# Altium project Karta Radiowa.PrjPcb (part 2 of 9)

## Sheet Komunikacja.SchDoc
size A3
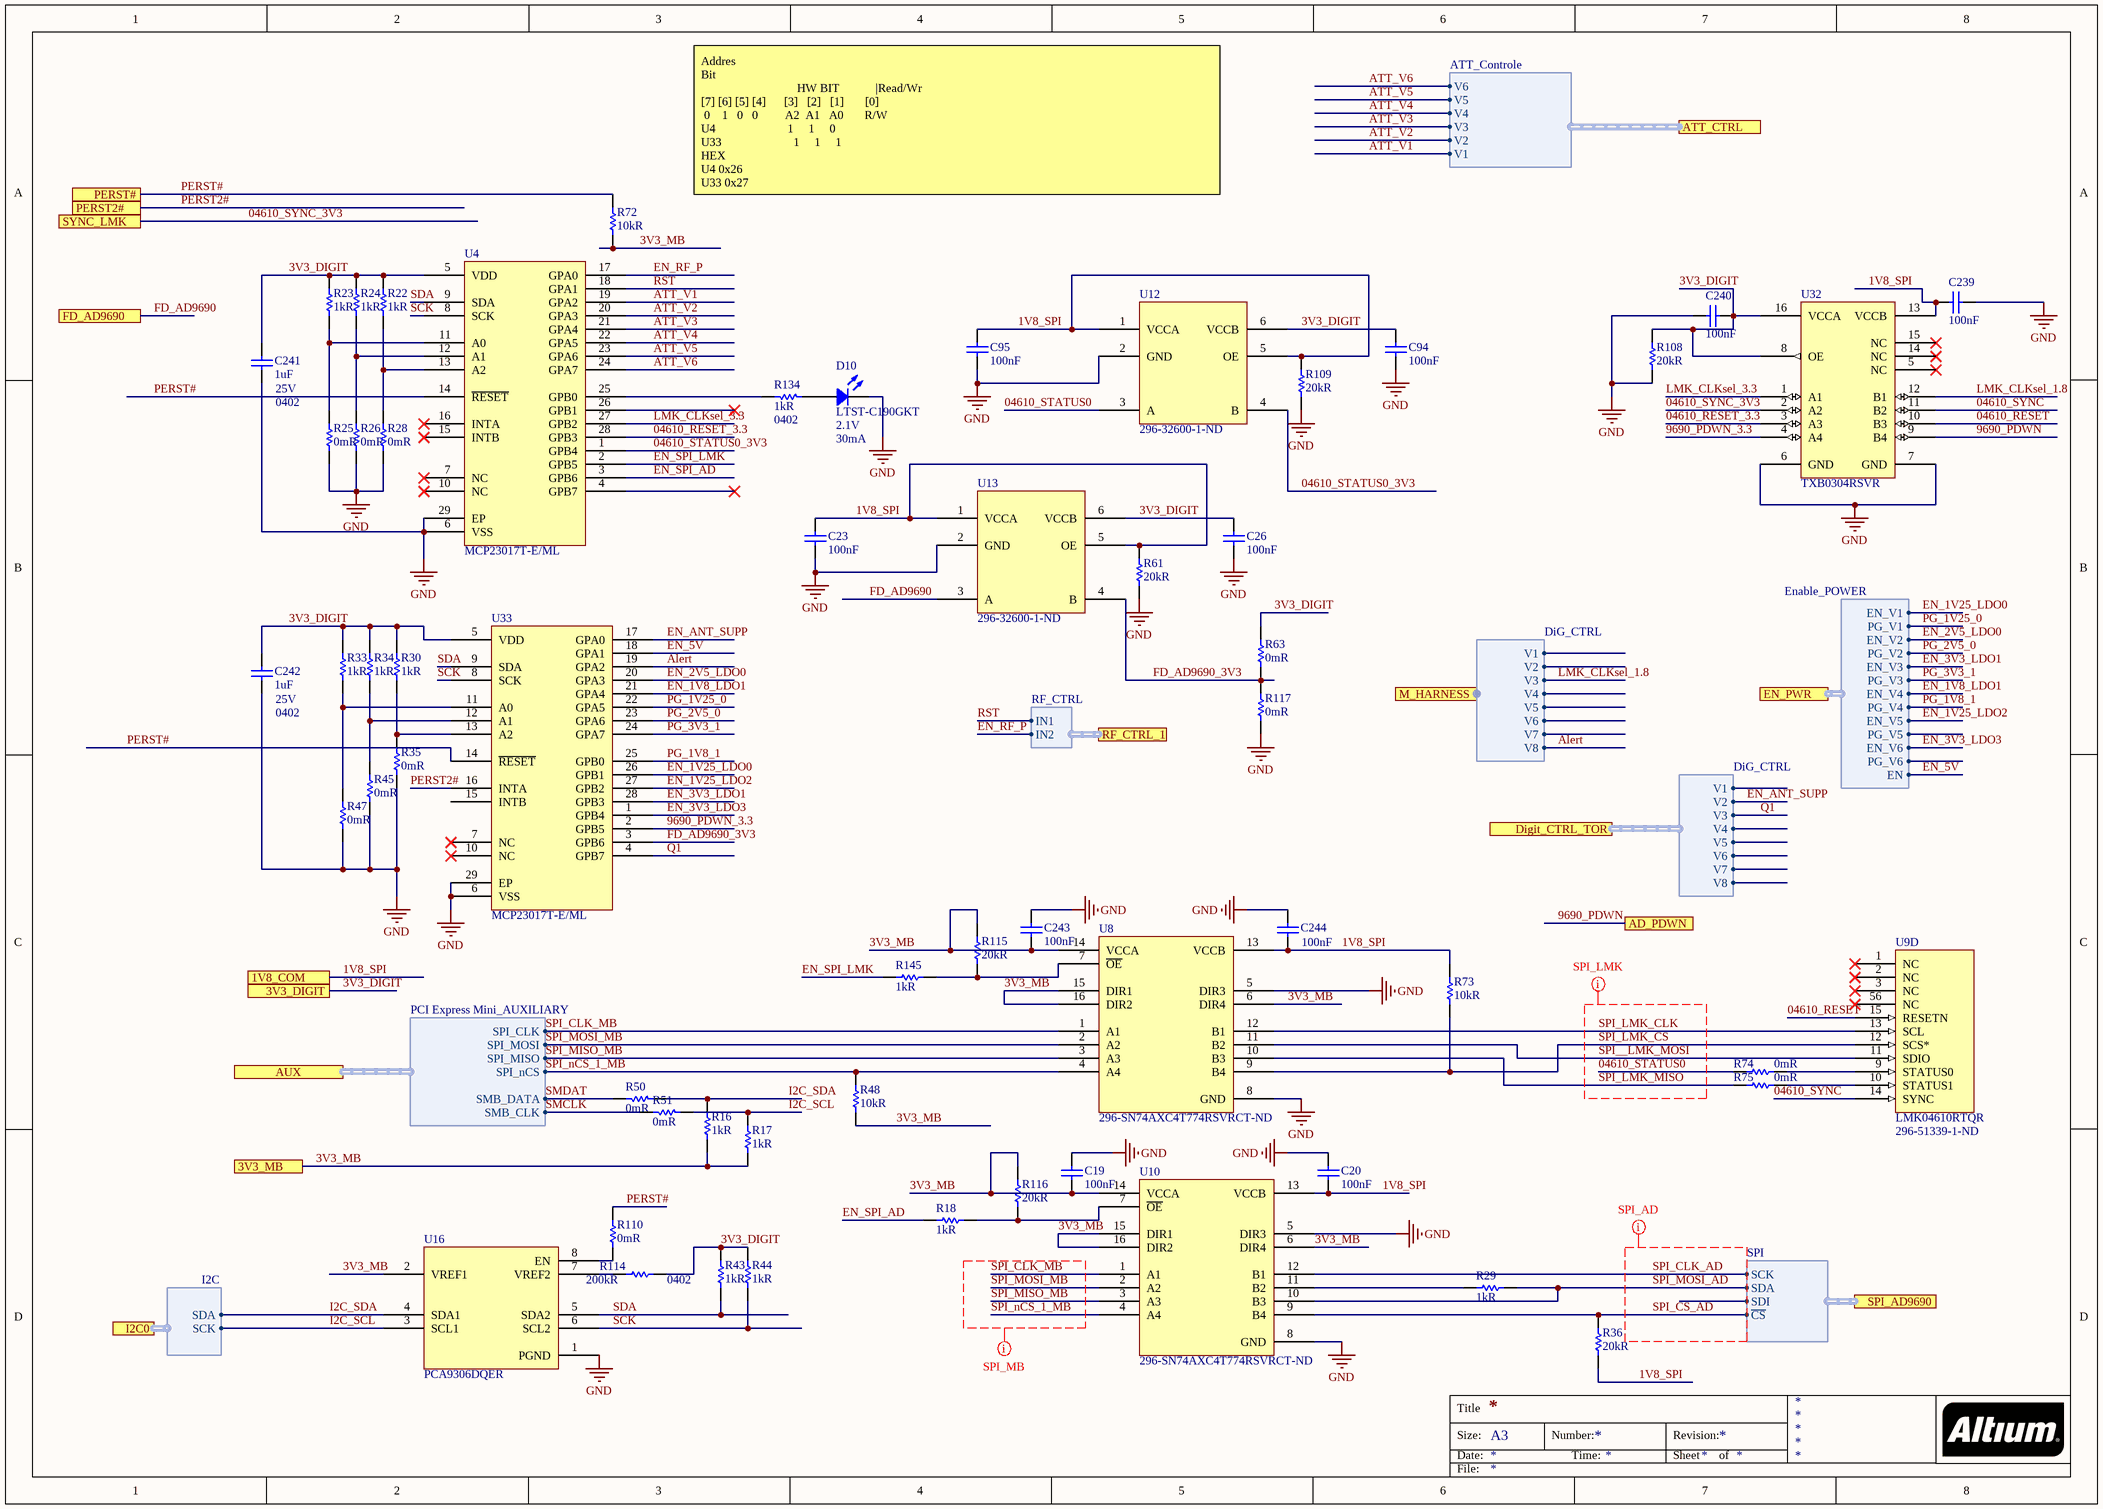
[diagram p2: Komunikacja.SchDoc]

### Parts
C19  100nF  [CAP 0201/0603 KK]
C20  100nF  [CAP 0201/0603 KK]
C23  100nF  [CAP 0201/0603 KK]
C26  100nF  [CAP 0201/0603 KK]
C94  100nF  [CAP 0201/0603 KK]
C95  100nF  [CAP 0201/0603 KK]
C239  100nF  [CAP 0201/0603 KK]
C240  100nF  [CAP 0201/0603 KK]
C241  1uF  Case/Package: 0402  Voltage Rating: 25V  [CAP 0402/1005 RF KK]
C242  1uF  Case/Package: 0402  Voltage Rating: 25V  [CAP 0402/1005 RF KK]
C243  100nF  [CAP 0201/0603 KK]
C244  100nF  [CAP 0201/0603 KK]
D10  LTST-C190GKT  Forward Voltage: 2.1V  Forward Current: 30mA  [LED 0603/1608 GREEN]
R16  1kR  [RES 0402/1005 RF KK]
R17  1kR  [RES 0402/1005 RF KK]
R18  1kR  [RES 0402/1005 RF KK]
R22  1kR  [RES 0402/1005 RF KK]
R23  1kR  [RES 0402/1005 RF KK]
R24  1kR  [RES 0402/1005 RF KK]
R25  0mR  [RES 0402/1005 RF KK]
R26  0mR  [RES 0402/1005 RF KK]
R28  0mR  [RES 0402/1005 RF KK]
R29  1kR  [RES 0402/1005 RF KK]
R30  1kR  [RES 0402/1005 RF KK]
R33  1kR  [RES 0402/1005 RF KK]
R34  1kR  [RES 0402/1005 RF KK]
R35  0mR  [RES 0402/1005 RF KK]
R36  20kR  [RES 0402/1005 RF KK]
R43  1kR  [RES 0402/1005 RF KK]
R44  1kR  [RES 0402/1005 RF KK]
R45  0mR  [RES 0402/1005 RF KK]
R47  0mR  [RES 0402/1005 RF KK]
R48  10kR  [RES 0402/1005 RF KK]
R50  0mR  [RES 0402/1005 RF KK]
R51  0mR  [RES 0402/1005 RF KK]
R61  20kR  [RES 0402/1005 RF KK]
R63  0mR  [RES 0402/1005 RF KK]
R72  10kR  [RES 0402/1005 RF KK]
R73  10kR  [RES 0402/1005 RF KK]
R74  0mR  [RES 0402/1005 RF KK]
R75  0mR  [RES 0402/1005 RF KK]
R108  20kR  [RES 0402/1005 RF KK]
R109  20kR  [RES 0402/1005 RF KK]
R110  0mR  [RES 0402/1005 RF KK]
R114  200kR  Case/Package: 0402  [RES 0402/1005 RF KK]
R115  20kR  [RES 0402/1005 RF KK]
R116  20kR  [RES 0402/1005 RF KK]
R117  0mR  [RES 0402/1005 RF KK]
R134  1kR  Case/Package: 0402  [RES 0402/1005 RF KK]
R145  1kR  [RES 0402/1005 RF KK]
U4  MCP23017T-E/ML  [MCP23017/MCP23S17]
U8  Supplier Part Number 1: 296-SN74AXC4T774RSVRCT-ND  [16-UGFN]  (hidden comment: SN74AXC4T774RSVR)
U9  LMK04610RTQR  Supplier Part Number 1: 296-51339-1-ND  [LMK04610]  (part D of 4)
U10  Supplier Part Number 1: 296-SN74AXC4T774RSVRCT-ND  [16-UGFN]  (hidden comment: SN74AXC4T774RSVR)
U12  Supplier Part Number 1: 296-32600-1-ND  [6-SOT DRL0006A]  (hidden comment: TXB0101DRLT)
U13  Supplier Part Number 1: 296-32600-1-ND  [6-SOT DRL0006A]  (hidden comment: TXB0101DRLT)
U16  PCA9306DQER  [PCA9306]
U32  TXB0304RSVR  [TXB0304]
U33  MCP23017T-E/ML  [MCP23017/MCP23S17]

### Ports
1V8_COM, 3V3_DIGIT, 3V3_MB, AD_PDWN, ATT_CTRL (harness ATT_Controle), AUX (harness PCI Express Mini_AUXILIARY), Digit_CTRL_TOR (harness DiG_CTRL), EN_PWR (harness Enable_POWER), FD_AD9690, I2C0 (harness I2C), M_HARNESS (harness DiG_CTRL), PERST2#, PERST#, RF_CTRL_1 (harness RF_CTRL), SPI_AD9690 (harness SPI), SYNC_LMK

### Harnesses
I2C: SDA, SCK
PCI Express Mini_AUXILIARY: SMB_DATA, SMB_CLK, SPI_nCS, SPI_MISO, SPI_MOSI, SPI_CLK
ATT_Controle: V1, V2, V3, V4, V5, V6
DiG_CTRL: V1, V2, V3, V4, V5, V6, V7, V8
SPI: SCK, ~{CS}, SDA, SDI
Enable_POWER: EN_V1, PG_V1, EN_V2, PG_V2, EN_V3, PG_V3, EN_V4, PG_V4, EN_V5, PG_V5, EN_V6, PG_V6, EN
RF_CTRL: IN1, IN2

### Nets
3V3_MB: C19.1 C243.1 R16.2 R17.1 R48.2 R72.1 R115.2 R116.2 U8.6(DIR4) U8.14(VCCA) U8.15(DIR1) U8.16(DIR2) U10.6(DIR4) U10.14(VCCA) U10.15(DIR1) U10.16(DIR2) U16.2(VREF1) ; port 3V3_MB
GND: C19.2 C20.2 C23.1 C26.1 C94.1 C95.1 C239.2 C240.1 C241.1 C242.1 C243.2 C244.2 D10.2 R25.1 R26.1 R28.1 R35.1 R45.1 R47.1 R61.1 R108.1 R109.1 R117.1 U4.6(VSS) U4.29(EP) U8.5(DIR3) U8.8(GND) U10.5(DIR3) U10.8(GND) U12.2(GND) U13.2(GND) U16.1(PGND) U32.6(GND) U32.7(GND) U33.6(VSS) U33.29(EP)
1V8_SPI: C20.1 C23.2 C95.2 C239.1 C244.1 R36.1 R61.2 R73.2 R109.2 U8.13(VCCB) U10.13(VCCB) U12.1(VCCA) U12.5(OE) U13.1(VCCA) U13.5(OE) U32.13(VCCB) ; port 1V8_COM  [project net 1V8@0A5_COM]
3V3_DIGIT: C26.2 C94.2 C240.2 C241.2 C242.2 R22.2 R23.2 R24.2 R30.2 R33.2 R34.2 R43.2 R44.2 R63.2 R108.2 R114.2 U4.5(VDD) U12.6(VCCB) U13.6(VCCB) U32.8(OE) U32.16(VCCA) U33.5(VDD) ; port 3V3_DIGIT  [project net 3V3@0A5_COM]
04610_RESET: U9.15(RESETN) U32.10(B3)
04610_RESET_3.3: U4.28(GPB3) U32.3(A3)
04610_STATUS0: R74.2 U12.3(A)
04610_STATUS0_3V3: U4.1(GPB4) U12.4(B)
04610_SYNC: U9.14(SYNC) U32.11(B2)
04610_SYNC_3V3: U32.2(A2) ; port SYNC_LMK
9690_PDWN: U32.9(B4) ; port AD_PDWN
9690_PDWN_3.3: U32.4(A4) U33.2(GPB5)
Alert: U33.19(GPA2) ; port M_HARNESS.V8
ATT_V1: U4.19(GPA2) ; port ATT_CTRL.V1
ATT_V2: U4.20(GPA3) ; port ATT_CTRL.V2
ATT_V3: U4.21(GPA4) ; port ATT_CTRL.V3
ATT_V4: U4.22(GPA5) ; port ATT_CTRL.V4
ATT_V5: U4.23(GPA6) ; port ATT_CTRL.V5
ATT_V6: U4.24(GPA7) ; port ATT_CTRL.V6
EN_1V8_LDO1: U33.21(GPA4) ; port EN_PWR.EN_V4
EN_1V25_LDO0: U33.26(GPB1) ; port EN_PWR.EN_V1
EN_1V25_LDO2: U33.27(GPB2) ; port EN_PWR.EN_V5
EN_2V5_LDO0: U33.20(GPA3) ; port EN_PWR.EN_V2
EN_3V3_LDO1: U33.28(GPB3) ; port EN_PWR.EN_V3
EN_3V3_LDO3: U33.1(GPB4) ; port EN_PWR.EN_V6
EN_5V: U33.18(GPA1) ; port EN_PWR.EN
EN_ANT_SUPP: U33.17(GPA0) ; port Digit_CTRL_TOR.V2
EN_RF_P: U4.17(GPA0) ; port RF_CTRL_1.IN2
EN_SPI_AD: R18.2 U4.3(GPB6)
EN_SPI_LMK: R145.2 U4.2(GPB5)
FD_AD9690: U13.3(A) ; port FD_AD9690  [project net 9690_FAST_DETECT]
FD_AD9690_3V3: R63.1 R117.2 U13.4(B) U33.3(GPB6)
I2C_SCL: R17.2 R51.2 U16.3(SCL1) ; port I2C0.SCK
I2C_SDA: R16.1 R50.2 U16.4(SDA1) ; port I2C0.SDA
LMK_CLKsel_1.8: U32.12(B1) ; port M_HARNESS.V3  [project net LMK_CLKsel]
LMK_CLKsel_3.3: U4.27(GPB2) U32.1(A1)
PERST2#: U33.16(INTA) ; port PERST2#
PERST#: R72.2 R110.2 U4.14(~{RESET}) U33.14(~{RESET}) ; port PERST#
PG_1V8_1: U33.25(GPB0) ; port EN_PWR.PG_V4
PG_1V25_0: U33.22(GPA5) ; port EN_PWR.PG_V1
PG_2V5_0: U33.23(GPA6) ; port EN_PWR.PG_V2
PG_3V3_1: U33.24(GPA7) ; port EN_PWR.PG_V3
Q1: U33.4(GPB7) ; port Digit_CTRL_TOR.V3  [project net Q]
RST: U4.18(GPA1) ; port RF_CTRL_1.IN1
SCK: R44.1 U4.8(SCK) U16.6(SCL2) U33.8(SCK)
SDA: R43.1 U4.9(SDA) U16.5(SDA2) U33.9(SDA)
SMCLK: R51.1 ; port AUX.SMB_CLK
SMDAT: R50.1 ; port AUX.SMB_DATA
SPI__LMK_MOSI: U8.11(B2) U9.11(SDIO)
SPI_CLK_AD: U10.12(B1) ; port SPI_AD9690.SCK
SPI_CLK_MB: U8.1(A1) U10.1(A1) ; port AUX.SPI_CLK
SPI_CS_AD: R36.2 U10.9(B4) ; port SPI_AD9690.~{CS}
SPI_LMK_CLK: U8.12(B1) U9.13(SCL)
SPI_LMK_CS: R73.1 U8.9(B4) U9.12(SCS*)
SPI_LMK_MISO: R75.2 U8.10(B3)
SPI_MISO_MB: U8.3(A3) U10.3(A3) ; port AUX.SPI_MISO
SPI_MOSI_AD: R29.1 U10.10(B3) ; port SPI_AD9690.SDA
SPI_MOSI_MB: U8.2(A2) U10.2(A2) ; port AUX.SPI_MOSI
SPI_nCS_1_MB: R48.1 U8.4(A4) U10.4(A4) ; port AUX.SPI_nCS
NetD10_1: D10.1 R134.1
NetR18_1: R18.1 R116.1 U10.7(~{OE})
NetR22_1: R22.1 R28.2 U4.13(A2)
NetR23_1: R23.1 R25.2 U4.11(A0)
NetR24_1: R24.1 R26.2 U4.12(A1)
NetR29_2: R29.2 U10.11(B2)
NetR30_1: R30.1 R35.2 U33.13(A2)
NetR33_1: R33.1 R47.2 U33.11(A0)
NetR34_1: R34.1 R45.2 U33.12(A1)
NetR74_1: R74.1 U9.9(STATUS0)
NetR75_1: R75.1 U9.10(STATUS1)
NetR110_1: R110.1 U16.8(EN)
NetR114_1: R114.1 U16.7(VREF2)
NetR115_1: R115.1 R145.1 U8.7(~{OE})
NetR134_2: R134.2 U4.25(GPB0)

Not connected (* = marked no-connect by the designer): U4 4(GPB7)* 7(NC)* 10(NC)* 15(INTB)* 16(INTA)* 26(GPB1)*; U9 1(NC)* 2(NC)* 3(NC)* 56(NC)*; U32 5(NC)* 14(NC)* 15(NC)*; U33 7(NC)* 10(NC)* 15(INTB)

### Layout directives
net class SPI_LMK: 04610_STATUS0, SPI__LMK_MOSI, SPI_LMK_CLK, SPI_LMK_CS, SPI_LMK_MISO
net class SPI_AD: SPI_CLK_AD, SPI_CS_AD, SPI_MOSI_AD
net class SPI_MB: SPI_CLK_MB, SPI_MISO_MB, SPI_MOSI_MB, SPI_nCS_1_MB

### Notes on the sheet
- Addres
  Bit
  HW BIT            |Read/Wr
  [7] [6] [5] [4]      [3]   [2]   [1]       [0]
  0    1   0   0         A2  A1   A0       R/W
  U4                        1     1     0
  U33                        1     1     1
  HEX
  U4 0x26
  U33 0x27
- Title
- Size:
- Date:
- A3
- Number:
- Time:
- Revision:
- Sheet
- of
- File:

### Library data of the parts
C19 C20 C23 C26 C94 C95 C239 C240 C243 C244 = Capacitor: Manufacturer 1: Murata; Manufacturer Part Number 1: GRM033R61C104ME84D; Voltage Rating: 16V; Tolerance: 20%; Dielectric: X5R; Supplier 1: Digi-Key; Supplier Part Number 1: 490-9986-1-ND; Stock 1: 550070; Pricing 1: 1=0.10000, 10=0.05400, 100=0.02430, 500=0.01732, 1000=0.01361, 2500=0.01238, 5000=0.01139 (USD); RoHS: Yes; Mount: Surface Mount; Case/Package: 0201; Weight: 1.2E-05oz; Case Code (Metric): 0603; Case Code (Imperial): 0201; Min Operating Temperature: -55°C; Max Operating Temperature: 85°C; Capacitance: 100nF; Packaging: Tape and Reel; Termination: SMD/SMT; Voltage Rating (DC): 16V; Package Quantity: 15000; Length: 0.024inch; Height: 0.3mm; Width: 0.3mm; Thickness: 0.013inch; ComponentLink1URL: http://www.mouser.com/ds/2/281/c02e-2905.pdf?src-supplier=Mouser; ComponentLink1Description: http://www.mouser.com/ds/2/281/c02e-2905.pdf?src-supplier=Mouser; ComponentLink2URL: http://search.murata.co.jp/Ceramy/image/img/A01X/G101/ENG/GRM033R61C104ME84-01.pdf?src-supplier=Digi-Key; ComponentLink2Description: http://search.murata.co.jp/Ceramy/image/img/A01X/G101/ENG/GRM033R61C104ME84-01.pdf?src-supplier=Digi-Key
C241 C242 = Capacitor: MURATA - GRT155R61E105KE01D - SMD Multilayer Ceramic Capacitor, 1 µF, 25 V, 0402 [1005 Metric], ± 10%, X5R, GRT Series - SMD Multilayer Ceramic Capacitor, 1 µF, 25 V, 0402 [1005 Metric], ± 10%, X5R, GRT Series; Supplier 1: Digi-Key; Supplier Part Number 1: 490-12263-1-ND; Manufacturer: Murata; Manufacturer Part Number: GRT155R61E105KE01D; RoHS: Yes; Category: Ceramic Capacitors; Stock 1: 341453; Pricing 1: 1=0,18000, 10=0,12300, 100=0,06210, 500=0,04248, 1000=0,03758, 2500=0,03594, 5000=0,03268 (USD); Mount: Surface Mount; Case Code (Metric): 1005; Case Code (Imperial): 0402; Min Operating Temperature: -55°C; Max Operating Temperature: 85°C; Packaging: Tape and Reel; Capacitance: 1uF; Tolerance: 10%; Dielectric: X5R; Voltage Rating (DC): 25V; Length: 0.039inch; Width: 0.02inch; Thickness: 0.022inch; Ratings: AEC-Q200; ComponentLink1URL: http://www.farnell.com/datasheets/2165918.pdf?src-supplier=Farnell; ComponentLink1Description: http://www.farnell.com/datasheets/2165918.pdf?src-supplier=Farnell; ComponentLink2URL: http://search.murata.co.jp/Ceramy/image/img/A01X/G101/ENG/GRT155R61E105KE01-01.pdf?src-supplier=Digi-Key; ComponentLink2Description: http://search.murata.co.jp/Ceramy/image/img/A01X/G101/ENG/GRT155R61E105KE01-01.pdf?src-supplier=Digi-Key; ComponentLink3URL: http://www.farnell.com/datasheets/2165918.pdf?src-supplier=Element14; ComponentLink3Description: http://www.farnell.com/datasheets/2165918.pdf?src-supplier=Element14
D10 = LTST-C190GKT: LED,  LTST-C190GKT; Manufacturer 1: Vishay Lite-On; Color: Green; Lens Color: Colorless; Luminous Intensity: 6mcd; Viewing Angle: 130°; Lens Style: Clear,Diffused,Colorless,Rectangular; Power Rating: 100mW; Dominant Wavelength: 569nm; Test Current: 10mA; Lens Transparency: Clear; Number of Elements: 1; Wavelength: 565nm; Voltage: 2V; Reverse Voltage: 5V; Supplier 1: Digi-Key; Manufacturer Part Number 1: LTST-C190GKT; Stock 1: 908158; Pricing 1: 1=0.26000, 10=0.18800, 100=0.08880, 500=0.05922, 1000=0.04639 (USD); RoHS: Yes; Mount: Surface Mount; Case/Package: 0603; Number of Pins: 2; Case Code (Metric): 1608; Case Code (Imperial): 0603; Min Operating Temperature: -55°C; Max Operating Temperature: 85°C; Package Quantity: 1; Packaging: Tape and Reel; Illumination Color: Green; Power Dissipation: 100mW; Number of LEDs: 1; Length: 1.6mm; Height: 0.8mm; Width: 0.8mm; Depth: 0.8mm; Radiation Hardening: No; Lead Free: Lead Free; ComponentLink1URL: https://datasheet.ciiva.com/11775/0900766b80dc02a6-11775616.pdf?src-supplier=RSComponents; ComponentLink1Description: https://datasheet.ciiva.com/11775/0900766b80dc02a6-11775616.pdf?src-supplier=RSComponents; ComponentLink2URL: https://datasheet.ciiva.com/2109/ltst-c190gkt-2109985.pdf?src-supplier=Digi-Key; ComponentLink2Description: https://datasheet.ciiva.com/2109/ltst-c190gkt-2109985.pdf?src-supplier=Digi-Key; ComponentLink3URL: https://datasheet.ciiva.com/16392/lite-on20ltst-c190gkt-16392818.pdf?src-supplier=Future+Electronics; ComponentLink3Description: https://datasheet.ciiva.com/16392/lite-on20ltst-c190gkt-16392818.pdf?src-supplier=Future+Electronics; ComponentLink4URL: https://datasheet.ciiva.com/12403/lite-on-ltst-c190gkt-187204-12403884.pdf?src-supplier=Mouser; ComponentLink4Description: https://datasheet.ciiva.com/12403/lite-on-ltst-c190gkt-187204-12403884.pdf?src-supplier=Mouser; ComponentLink5URL: https://datasheet.ciiva.com/2109/ltst-c190gkt-2109986.pdf?src-supplier=Digi-Key; ComponentLink5Description: https://datasheet.ciiva.com/2109/ltst-c190gkt-2109986.pdf?src-supplier=Digi-Key; ComponentLink6URL: https://datasheet.ciiva.com/2109/ltst-c190gkt-2109987.pdf?src-supplier=Digi-Key; ComponentLink6Description: https://datasheet.ciiva.com/2109/ltst-c190gkt-2109987.pdf?src-supplier=Digi-Key; Supplier Part Number 1: 160-1183-1-ND
R16-R18 R22-R24 R29 R30 R33 R34 R43 R44 R134 R145 = Resistor: Manufacturer 1: Yageo; Manufacturer Part Number 1: RC0402FR-071KL; Tolerance: 1%; Temperature Coefficient: 100ppm/°C; Power Rating: 62.5mW; Voltage Rating: 50V; Supplier 1: Digi-Key; Supplier Part Number 1: 311-1.00KLRCT-ND; Stock 1: 57541929; Pricing 1: 1=0,10000, 10=0,01600, 100=0,00640, 1000=0,00289, 2500=0,00251, 5000=0,00207 (USD); RoHS: Yes; Number of Pins: 2; Case Code (Imperial): 0402; Case Code (Metric): 1005; Min Operating Temperature: -55°C; Max Operating Temperature: 155°C; Packaging: Tape and Reel; Resistance: 1kR; Composition: Thick Film; Voltage Rating (DC): 50V; Termination: SMD/SMT; Military Standard: Not; Length: 1mm; Height: 0.32mm; Width: 0.5mm; Depth: 0.5mm; REACH SVHC: Unknown; Lead Free: Lead Free; ComponentLink1URL: https://datasheet.ciiva.com/11819/0900766b80c66297-11819477.pdf?src-supplier=RSComponents; ComponentLink1Description: https://datasheet.ciiva.com/11819/0900766b80c66297-11819477.pdf?src-supplier=RSComponents; ComponentLink2URL: https://datasheet.ciiva.com/12666/pyu-rc0402-51-rohs-l-6-r-12666741.pdf?src-supplier=Mouser; ComponentLink2Description: https://datasheet.ciiva.com/12666/pyu-rc0402-51-rohs-l-6-r-12666741.pdf?src-supplier=Mouser; ComponentLink3URL: https://datasheet.ciiva.com/17063/pyu-rc0402-51-rohs-l-6-r-17063193.pdf?src-supplier=Future+Electronics; ComponentLink3Description: https://datasheet.ciiva.com/17063/pyu-rc0402-51-rohs-l-6-r-17063193.pdf?src-supplier=Future+Electronics; ComponentLink4URL: https://datasheet.ciiva.com/22747/1018594-22747513.pdf?src-supplier=Element14; ComponentLink4Description: https://datasheet.ciiva.com/22747/1018594-22747513.pdf?src-supplier=Element14; ComponentLink5URL: https://datasheet.ciiva.com/7849/1018594-7849869.pdf?src-supplier=Element14; ComponentLink5Description: https://datasheet.ciiva.com/7849/1018594-7849869.pdf?src-supplier=Element14; ComponentLink6URL: https://datasheet.ciiva.com/7983/1018594-7983502.pdf?src-supplier=Element14; ComponentLink6Description: https://datasheet.ciiva.com/7983/1018594-7983502.pdf?src-supplier=Element14; ComponentLink7URL: https://datasheet.ciiva.com/7849/1018594-7849871.pdf?src-supplier=Element14; ComponentLink7Description: https://datasheet.ciiva.com/7849/1018594-7849871.pdf?src-supplier=Element14
  R16-R18 R22-R24 R29 R30 R33 R34 R43 R44 R145: Case/Package: 0402
R25 R26 R28 R35 R45 R47 R50 R51 R63 R74 R75 R110 R117 = Resistor: Manufacturer 1: Yageo; Manufacturer Part Number 1: RC0402JR-070RL; Power Rating: 62.5mW; Tolerance: 5%; Voltage Rating: 50V; Max Power Dissipation: 63mW; Temperature Coefficient: 200ppm/°C; Supplier 1: Digi-Key; Supplier Part Number 1: 311-0.0JRCT-ND; Pricing 1: 1=0.10000, 10=0.01200, 25=0.00920, 50=0.00680, 100=0.00510, 250=0.00388, 500=0.00308, 1000=0.00227, 5000=0.00163 (USD); RoHS: Yes; Case/Package: 0402; Contact Plating: Tin,Matte; Case Code (Metric): 1005; Case Code (Imperial): 0402; Min Operating Temperature: -55°C; Max Operating Temperature: 155°C; Resistance: 0mR; Packaging: Tape and Reel; Composition: Thick Film; Package Quantity: 1; Number of Terminations: 2; Termination: SMD/SMT; Military Standard: Not; Features: Moisture Resistant; Length: 1mm; Height: 0.016inch; Width: 0.02inch; Depth: 0.5mm; Radiation Hardening: No; REACH SVHC: Unknown; Lead Free: Lead Free; ComponentLink1URL: https://datasheet.ciiva.com/2452/pyu-rc0402-51-rohs-l-6-2452608.pdf?src-supplier=Digi-Key; ComponentLink1Description: https://datasheet.ciiva.com/2452/pyu-rc0402-51-rohs-l-6-2452608.pdf?src-supplier=Digi-Key; ComponentLink2URL: https://datasheet.ciiva.com/11808/0900766b80c66297-11808195.pdf?src-supplier=RSComponents; ComponentLink2Description: https://datasheet.ciiva.com/11808/0900766b80c66297-11808195.pdf?src-supplier=RSComponents; ComponentLink3URL: https://datasheet.ciiva.com/2452/pyu-r-int-thick-7-2452609.pdf?src-supplier=Digi-Key; ComponentLink3Description: https://datasheet.ciiva.com/2452/pyu-r-int-thick-7-2452609.pdf?src-supplier=Digi-Key; ComponentLink4URL: https://datasheet.ciiva.com/22747/1018594-22747515.pdf?src-supplier=Element14; ComponentLink4Description: https://datasheet.ciiva.com/22747/1018594-22747515.pdf?src-supplier=Element14; ComponentLink5URL: https://datasheet.ciiva.com/7983/1018594-7983535.pdf?src-supplier=Element14; ComponentLink5Description: https://datasheet.ciiva.com/7983/1018594-7983535.pdf?src-supplier=Element14; ComponentLink6URL: https://datasheet.ciiva.com/2452/pyu-r-int-thick-7-2452610.pdf?src-supplier=Digi-Key; ComponentLink6Description: https://datasheet.ciiva.com/2452/pyu-r-int-thick-7-2452610.pdf?src-supplier=Digi-Key; ComponentLink7URL: https://datasheet.ciiva.com/8896/pyu-rc0402-51-rohs-l-6-8896201.pdf?src-supplier=Avnet; ComponentLink7Description: https://datasheet.ciiva.com/8896/pyu-rc0402-51-rohs-l-6-8896201.pdf?src-supplier=Avnet; ComponentLink8URL: https://datasheet.ciiva.com/28386/pyu-rc0402-51-rohs-l-6-28386633.pdf?src-supplier=Avnet+Europe; ComponentLink8Description: https://datasheet.ciiva.com/28386/pyu-rc0402-51-rohs-l-6-28386633.pdf?src-supplier=Avnet+Europe; ComponentLink9URL: https://datasheet.ciiva.com/15189/getdatasheetpartid-326379-15189533.pdf?src-supplier=Verical; ComponentLink9Description: https://datasheet.ciiva.com/15189/getdatasheetpartid-326379-15189533.pdf?src-supplier=Verical
  R25 R26 R28 R35 R45 R47 R63 R74 R75 R110 R117: Stock 1: 69822252
  R50 R51: Stock 1: 71594280
R36 R61 R108 R109 R115 R116 = Resistor: YAGEO - RC0402FR-0720KL - RES, THICK FILM, 20K, 1%, 0.0625W, 0402; Power Rating: 62.5mW; Voltage Rating: 50V; Temperature Coefficient: 100ppm/°C; Max Power Dissipation: 63mW; Supplier 1: Digi-Key; Supplier Part Number 1: 311-20.0KLRCT-ND; Manufacturer: Yageo; Manufacturer Part Number: RC0402FR-0720KL; RoHS: Yes; Category: Chip SMD Resistors; Stock 1: 5041118; Pricing 1: 1=0,10000, 10=0,01500, 100=0,00620, 1000=0,00278, 2500=0,00242, 5000=0,00200 (USD); Case/Package: 0402; Number of Pins: 2; Case Code (Metric): 1005; Case Code (Imperial): 0402; Min Operating Temperature: -55°C; Max Operating Temperature: 155°C; Tolerance: 1%; Package Quantity: 1; Resistance: 20kR; Packaging: Tape and Reel; Resistor Type: Thick Film; Number of Terminations: 2; Termination: SMD/SMT; Voltage Rating (DC): 50V; Features: Moisture Resistant; Length: 1mm; Height: 0.016inch; Width: 0.02inch; Depth: 0.5mm; REACH SVHC: No SVHC; Military Standard: Not; Lead Free: Lead Free; ComponentLink1URL: https://datasheet.ciiva.com/11808/0900766b80c66297-11808454.pdf?src-supplier=RSComponents; ComponentLink1Description: https://datasheet.ciiva.com/11808/0900766b80c66297-11808454.pdf?src-supplier=RSComponents; ComponentLink2URL: https://datasheet.ciiva.com/2453/pyu-r-int-thick-7-2453493.pdf?src-supplier=Digi-Key; ComponentLink2Description: https://datasheet.ciiva.com/2453/pyu-r-int-thick-7-2453493.pdf?src-supplier=Digi-Key; ComponentLink3URL: https://datasheet.ciiva.com/2453/pyu-r-int-thick-7-2453494.pdf?src-supplier=Digi-Key; ComponentLink3Description: https://datasheet.ciiva.com/2453/pyu-r-int-thick-7-2453494.pdf?src-supplier=Digi-Key; ComponentLink4URL: https://datasheet.ciiva.com/2453/pyu-r-int-thick-7-2453495.pdf?src-supplier=Digi-Key; ComponentLink4Description: https://datasheet.ciiva.com/2453/pyu-r-int-thick-7-2453495.pdf?src-supplier=Digi-Key; ComponentLink5URL: https://datasheet.ciiva.com/7983/1018594-7983511.pdf?src-supplier=Element14; ComponentLink5Description: https://datasheet.ciiva.com/7983/1018594-7983511.pdf?src-supplier=Element14; ComponentLink6URL: https://datasheet.ciiva.com/12558/pyu-rc0402-51-rohs-l-6-r-8721-12558796.pdf?src-supplier=Mouser; ComponentLink6Description: https://datasheet.ciiva.com/12558/pyu-rc0402-51-rohs-l-6-r-8721-12558796.pdf?src-supplier=Mouser; ComponentLink7URL: https://datasheet.ciiva.com/46394/1018594-46394974.pdf?src-supplier=Element14; ComponentLink7Description: https://datasheet.ciiva.com/46394/1018594-46394974.pdf?src-supplier=Element14
R48 R72 R73 = Resistor: Manufacturer 1: Vishay; Manufacturer Part Number 1: CRCW0402-10K0FKED; Tolerance: 1%; Power Rating: 63mW; Voltage Rating: 50V; Temperature Coefficient: 100ppm/°C; Supplier 1: Newark; Supplier Part Number 1: 52K6595; Stock 1: 0; RoHS: Yes; Mount: Surface Mount; Case/Package: 0402; Number of Pins: 2; Weight: 2.3E-05oz; Case Code (Metric): 1005; Case Code (Imperial): 0402; Contact Plating: Tin; Min Operating Temperature: -55°C; Max Operating Temperature: 155°C; Resistance: 10kR; Package Quantity: 10; Packaging: Tape and Reel; Termination: SMD/SMT; Military Standard: Not; Composition: Thick Film; Voltage Rating (DC): 50V; Number of Terminations: 2; Max Power Dissipation: 63mW; Features: Automotive AEC-Q200; Length: 1mm; Height: 0.35mm; Depth: 0.5mm; Width: 0.02inch; Radiation Hardening: No; REACH SVHC: Unknown; Lead Free: Lead Free; ComponentLink1URL: https://datasheet.ciiva.com/11809/0900766b80d98824-11809984.pdf?src-supplier=RSComponents; ComponentLink1Description: https://datasheet.ciiva.com/11809/0900766b80d98824-11809984.pdf?src-supplier=RSComponents; ComponentLink2URL: https://datasheet.ciiva.com/2463/dcrcwe3-2463025.pdf?src-supplier=Digi-Key; ComponentLink2Description: https://datasheet.ciiva.com/2463/dcrcwe3-2463025.pdf?src-supplier=Digi-Key; ComponentLink3URL: https://datasheet.ciiva.com/2463/dcrcwe3-2463026.pdf?src-supplier=Digi-Key; ComponentLink3Description: https://datasheet.ciiva.com/2463/dcrcwe3-2463026.pdf?src-supplier=Digi-Key; ComponentLink4URL: https://datasheet.ciiva.com/2463/dcrcwe3-2463027.pdf?src-supplier=Digi-Key; ComponentLink4Description: https://datasheet.ciiva.com/2463/dcrcwe3-2463027.pdf?src-supplier=Digi-Key; ComponentLink5URL: https://datasheet.ciiva.com/46385/1697337-46385560.pdf?src-supplier=Element14; ComponentLink5Description: https://datasheet.ciiva.com/46385/1697337-46385560.pdf?src-supplier=Element14; ComponentLink6URL: https://datasheet.ciiva.com/3255/dcrcwe3-3255961.pdf?src-supplier=Avnet; ComponentLink6Description: https://datasheet.ciiva.com/3255/dcrcwe3-3255961.pdf?src-supplier=Avnet; ComponentLink7URL: https://datasheet.ciiva.com/3255/dcrcwe3-3255962.pdf?src-supplier=Avnet; ComponentLink7Description: https://datasheet.ciiva.com/3255/dcrcwe3-3255962.pdf?src-supplier=Avnet; ComponentLink8URL: https://datasheet.ciiva.com/5547/dcrcwe3-109170-5547786.pdf?src-supplier=Mouser; ComponentLink8Description: https://datasheet.ciiva.com/5547/dcrcwe3-109170-5547786.pdf?src-supplier=Mouser; ComponentLink9URL: https://datasheet.ciiva.com/26316/fld-crcw-e3-data-en-26316618.pdf?src-supplier=Distrelec; ComponentLink9Description: https://datasheet.ciiva.com/26316/fld-crcw-e3-data-en-26316618.pdf?src-supplier=Distrelec; ComponentLink10URL: https://datasheet.ciiva.com/16208/dcrcwe3-16208525.pdf?src-supplier=Future+Electronics; ComponentLink10Description: https://datasheet.ciiva.com/16208/dcrcwe3-16208525.pdf?src-supplier=Future+Electronics; ComponentLink11URL: https://datasheet.ciiva.com/36856/1720486-36856909.pdf?src-supplier=Element14; ComponentLink11Description: https://datasheet.ciiva.com/36856/1720486-36856909.pdf?src-supplier=Element14
R114 = Resistor: YAGEO - RC0402FR-07200KL - SMD Chip Resistor, 0402 [1005 Metric], 200 kohm, RC Series, 50 V, Thick Film, 63 mW; Power Rating: 62.5mW; Tolerance: 1%; Voltage Rating: 50V; Max Power Dissipation: 63mW; Temperature Coefficient: 100ppm/°C; Supplier 1: Digi-Key; Supplier Part Number 1: 311-200KLRCT-ND; Manufacturer: Yageo; Manufacturer Part Number: RC0402FR-07200KL; RoHS: Yes; Category: Chip SMD Resistors; Stock 1: 2329986; Pricing 1: 1=0,10000, 10=0,01400, 100=0,00580, 1000=0,00260, 2500=0,00226, 5000=0,00186 (USD); Case Code (Metric): 1005; Case Code (Imperial): 0402; Min Operating Temperature: -55°C; Max Operating Temperature: 155°C; Resistance: 200kR; Package Quantity: 1; Packaging: Tape and Reel; Resistor Type: Thick Film; Number of Terminations: 2; Termination: SMD/SMT; Voltage Rating (DC): 50V; Features: Moisture Resistant; Working Voltage: 50V; Length: 1mm; Width: 0.02inch; Height: 0.016inch; Depth: 0.5mm; REACH SVHC: No SVHC; Military Standard: Not; Lead Free: Lead Free; ComponentLink1URL: https://datasheet.ciiva.com/2453/pyu-r-int-thick-7-2453556.pdf?src-supplier=Digi-Key; ComponentLink1Description: https://datasheet.ciiva.com/2453/pyu-r-int-thick-7-2453556.pdf?src-supplier=Digi-Key; ComponentLink2URL: https://datasheet.ciiva.com/2453/pyu-r-int-thick-7-2453557.pdf?src-supplier=Digi-Key; ComponentLink2Description: https://datasheet.ciiva.com/2453/pyu-r-int-thick-7-2453557.pdf?src-supplier=Digi-Key; ComponentLink3URL: https://datasheet.ciiva.com/15189/getdatasheetpartid-323720-15189381.pdf?src-supplier=Verical; ComponentLink3Description: https://datasheet.ciiva.com/15189/getdatasheetpartid-323720-15189381.pdf?src-supplier=Verical; ComponentLink4URL: https://datasheet.ciiva.com/2453/pyu-r-int-thick-7-2453558.pdf?src-supplier=Digi-Key; ComponentLink4Description: https://datasheet.ciiva.com/2453/pyu-r-int-thick-7-2453558.pdf?src-supplier=Digi-Key; ComponentLink5URL: https://datasheet.ciiva.com/12667/pyu-rc0402-51-rohs-l-6-r-12667911.pdf?src-supplier=Mouser; ComponentLink5Description: https://datasheet.ciiva.com/12667/pyu-rc0402-51-rohs-l-6-r-12667911.pdf?src-supplier=Mouser; ComponentLink6URL: https://datasheet.ciiva.com/7849/1018594-7849896.pdf?src-supplier=Element14; ComponentLink6Description: https://datasheet.ciiva.com/7849/1018594-7849896.pdf?src-supplier=Element14; ComponentLink7URL: https://datasheet.ciiva.com/7849/1018594-7849897.pdf?src-supplier=Element14; ComponentLink7Description: https://datasheet.ciiva.com/7849/1018594-7849897.pdf?src-supplier=Element14; ComponentLink8URL: https://datasheet.ciiva.com/46394/1018594-46394953.pdf?src-supplier=Element14; ComponentLink8Description: https://datasheet.ciiva.com/46394/1018594-46394953.pdf?src-supplier=Element14; ComponentLink9URL: https://datasheet.ciiva.com/16740/pyu-rc0402-51-rohs-l-6-r-16740636.pdf?src-supplier=Future+Electronics; ComponentLink9Description: https://datasheet.ciiva.com/16740/pyu-rc0402-51-rohs-l-6-r-16740636.pdf?src-supplier=Future+Electronics
U4 U33 = MCP23017T-E/ML: IC I/O EXPANDER I2C 16B 28QFN; Manufacturer: Microchip; Output Current: 25mA; Interface: I2C,Serial; Operating Supply Voltage: 5.5V; Number of I/Os: 16; Power Dissipation: 700mW; Max Frequency: 1.7MHz; Supplier 1: Digi-Key; Manufacturer Part Number: MCP23017T-E/ML; Stock 1: 7016; Pricing 1: 1 = 1,45000, 25 = 1,21560, 100 = 1,10210 (USD); RoHS: Yes; Case/Package: QFN; Contact Plating: Tin,Matte; Min Operating Temperature: -40°C; Max Operating Temperature: 125°C; Package Quantity: 1600; Packaging: Tape and Reel; Frequency: 1.7MHz; Number of Bits: 16; Lead Free: Lead Free; ComponentLink1URL: https://datasheet.ciiva.com/1780/21952b-1780757.pdf?src-supplier=Digi-Key; ComponentLink1Description: https://datasheet.ciiva.com/1780/21952b-1780757.pdf?src-supplier=Digi-Key; ComponentLink2URL: https://datasheet.ciiva.com/16454/filehandler-aspxddocname-en023709-16454263.pdf?src-supplier=Future+Electronics; ComponentLink2Description: https://datasheet.ciiva.com/16454/filehandler-aspxddocname-en023709-16454263.pdf?src-supplier=Future+Electronics; ComponentLink3URL: https://datasheet.ciiva.com/8128/21952b-8128584.pdf?src-supplier=Avnet; ComponentLink3Description: https://datasheet.ciiva.com/8128/21952b-8128584.pdf?src-supplier=Avnet; Supplier Part Number 1: MCP23017T-E/MLCT-ND
U8 U10 = SN74AXC4T774RSVR: 4-bit dual-supply bus transceiver with 3-state outputs and independent direction control inputs 16-UQFN -40 to 125; Manufacturer: Texas Instruments; Supplier 1: Digi-Key; Manufacturer Part Number: SN74AXC4T774RSVR; RoHS: No; Category: Buffers, Drivers and Transceivers; Stock 1: 2179; Pricing 1: 1=1,21000, 10=1,08600, 25=1,03040, 100=0,84640, 250=0,79120, 500=0,69920, 1000=0,55200 (USD)
U9 = LMK04610RTQR: Manufacturer: Texas Instruments; Number of Inputs: 2; Number of Outputs: 10; Supplier 1: Digi-Key; Manufacturer Part Number: LMK04610RTQR; Stock 1: 2022; Pricing 1: 1 = 20,47000, 10 = 18,87700, 100 = 16,11940, 500 = 14,63474 (USD); RoHS: No; Min Operating Temperature: -40°C; Max Operating Temperature: 85°C
U12 U13 = TXB0101DRLT: TXB0101 (LVC1T55) DRLT Setup; Manufacturer: Texas Instruments; Data Rate: 100Mbps; Number of Channels: 1; Propagation Delay: 4ns; Max Supply Voltage: 5.5V; Min Supply Voltage: 1.65V; Logic Function: Translator; Low Level Output Current: 20uA; High Level Output Current: -20uA; Turn-On Delay Time: 31ns; Supplier 1: Digi-Key; Manufacturer Part Number: TXB0101DRLT; RoHS: Yes; Category: Integrated Circuits (ICs); Stock 1: 1962; Pricing 1: 1=0,56000, 10=0,49500, 25=0,46520, 100=0,37950 (USD); Mount: Surface Mount; Case/Package: SOT-553-6; Number of Pins: 6; Weight: 9.9E-05oz; Contact Plating: Gold; Min Operating Temperature: -40°C; Max Operating Temperature: 85°C; Packaging: Tape and Reel; Package Quantity: 1; Number of Bits: 1; Length: 1.7mm; Height: 0.55mm; Width: 1.3mm; Radiation Hardening: No; Lead Free: Lead Free; ComponentLink1URL: https://datasheet.ciiva.com/15096/getdatasheetpartid-539440-15096428.pdf?src-supplier=Verical; ComponentLink1Description: https://datasheet.ciiva.com/15096/getdatasheetpartid-539440-15096428.pdf?src-supplier=Verical; ComponentLink2URL: https://datasheet.ciiva.com/6615/txb0101-6615081.pdf?src-supplier=Digi-Key; ComponentLink2Description: https://datasheet.ciiva.com/6615/txb0101-6615081.pdf?src-supplier=Digi-Key; ComponentLink3URL: https://datasheet.ciiva.com/6615/txb0101-6615083.pdf?src-supplier=Digi-Key; ComponentLink3Description: https://datasheet.ciiva.com/6615/txb0101-6615083.pdf?src-supplier=Digi-Key; ComponentLink4URL: https://datasheet.ciiva.com/6615/txb0101-6615084.pdf?src-supplier=Digi-Key; ComponentLink4Description: https://datasheet.ciiva.com/6615/txb0101-6615084.pdf?src-supplier=Digi-Key
U16 = PCA9306DQER: TEXAS INSTRUMENTS   PCA9306DQER.   IC, SMBus, 5V, X2SON-8; Number of Channels: 2; Propagation Delay: 0.3ns; Min Supply Voltage: 0uV; Logic Function: Translator; Turn-On Delay Time: 1.4ns; Low Level Output Current: 128mA; Output Type: I2C; Supplier 1: Digi-Key; Manufacturer 1: Texas Instruments; Manufacturer Part Number 1: PCA9306DQER; Stock 1: 25002; Pricing 1: 1=0,67000, 10=0,59100, 100=0,45340, 500=0,35844, 1000=0,28675 (USD); RoHS: Yes; Number of Pins: 8; Min Operating Temperature: -40°C; Max Operating Temperature: 85°C; Max Supply Voltage: 5V; Package Quantity: 1; Number of Outputs: 2; Number of Bits: 2; Packaging: Tape and Reel; Length: 1.45mm; Height: 0.35mm; Width: 1.05mm; Radiation Hardening: No; REACH SVHC: No SVHC; Lead Free: Lead Free; ComponentLink1URL: https://datasheet.ciiva.com/22631/1719693-22631024.pdf?src-supplier=Element14; ComponentLink1Description: https://datasheet.ciiva.com/22631/1719693-22631024.pdf?src-supplier=Element14; ComponentLink2URL: https://datasheet.ciiva.com/1899/pca9306-1899328.pdf?src-supplier=Digi-Key; ComponentLink2Description: https://datasheet.ciiva.com/1899/pca9306-1899328.pdf?src-supplier=Digi-Key; ComponentLink3URL: https://datasheet.ciiva.com/15095/getdatasheetpartid-306496-15095555.pdf?src-supplier=Verical; ComponentLink3Description: https://datasheet.ciiva.com/15095/getdatasheetpartid-306496-15095555.pdf?src-supplier=Verical; ComponentLink4URL: https://datasheet.ciiva.com/1504/1862428-1504149.pdf?src-supplier=Element14; ComponentLink4Description: https://datasheet.ciiva.com/1504/1862428-1504149.pdf?src-supplier=Element14; ComponentLink5URL: https://datasheet.ciiva.com/1899/pca9306-1899326.pdf?src-supplier=Digi-Key; ComponentLink5Description: https://datasheet.ciiva.com/1899/pca9306-1899326.pdf?src-supplier=Digi-Key; ComponentLink6URL: https://datasheet.ciiva.com/14287/pca9306-14287374.pdf?src-supplier=Avnet; ComponentLink6Description: https://datasheet.ciiva.com/14287/pca9306-14287374.pdf?src-supplier=Avnet; ComponentLink7URL: https://datasheet.ciiva.com/14287/pca9306-14287470.pdf?src-supplier=Avnet; ComponentLink7Description: https://datasheet.ciiva.com/14287/pca9306-14287470.pdf?src-supplier=Avnet; ComponentLink8URL: https://datasheet.ciiva.com/1899/pca9306-1899327.pdf?src-supplier=Digi-Key; ComponentLink8Description: https://datasheet.ciiva.com/1899/pca9306-1899327.pdf?src-supplier=Digi-Key; ComponentLink9URL: https://datasheet.ciiva.com/26041/pca9306-26041014.pdf?src-supplier=Avnet+Europe; ComponentLink9Description: https://datasheet.ciiva.com/26041/pca9306-26041014.pdf?src-supplier=Avnet+Europe; Supplier Part Number 1: 296-27957-1-ND
U32 = TXB0304RSVR: IC TRNSLTR BIDIRECTIONAL 16UQFN; Manufacturer 1: Texas Instruments; Nominal Supply Current: 5uA; Max Supply Voltage: 3.6V; Min Supply Voltage: 900mV; Data Rate: 140Mbps; Number of Channels: 4; Propagation Delay: 4.8ns; Logic Function: Translator; Turn-On Delay Time: 18.9ns; High Level Output Current: -20uA; Low Level Output Current: 20uA; Quiescent Current: 10uA; Supplier 1: Digi-Key; Manufacturer Part Number 1: TXB0304RSVR; Stock 1: 1758; Pricing 1: 1=1.45000, 10=1.29700, 100=1.01160, 500=0.83564, 1000=0.65972 (USD); RoHS: Yes; Mount: Surface Mount; Number of Pins: 16; Contact Plating: Gold; Min Operating Temperature: -40°C; Max Operating Temperature: 85°C; Packaging: Tape and Reel; Package Quantity: 1; Number of Bits: 4; Number of Inputs: 4; Number of Outputs: 4; Radiation Hardening: No; REACH SVHC: No SVHC; Lead Free: Lead Free; ComponentLink1URL: https://datasheet.ciiva.com/1900/txb0304-1900817.pdf?src-supplier=Digi-Key; ComponentLink1Description: https://datasheet.ciiva.com/1900/txb0304-1900817.pdf?src-supplier=Digi-Key; ComponentLink2URL: https://datasheet.ciiva.com/15096/getdatasheetpartid-490462-15096317.pdf?src-supplier=Verical; ComponentLink2Description: https://datasheet.ciiva.com/15096/getdatasheetpartid-490462-15096317.pdf?src-supplier=Verical; ComponentLink3URL: https://datasheet.ciiva.com/1900/txb0304-1900818.pdf?src-supplier=Digi-Key; ComponentLink3Description: https://datasheet.ciiva.com/1900/txb0304-1900818.pdf?src-supplier=Digi-Key; ComponentLink4URL: https://datasheet.ciiva.com/1900/txb0304-1900819.pdf?src-supplier=Digi-Key; ComponentLink4Description: https://datasheet.ciiva.com/1900/txb0304-1900819.pdf?src-supplier=Digi-Key; ComponentLink5URL: https://datasheet.ciiva.com/14287/txb0304-14287243.pdf?src-supplier=Avnet; ComponentLink5Description: https://datasheet.ciiva.com/14287/txb0304-14287243.pdf?src-supplier=Avnet; Supplier Part Number 1: 296-29681-1-ND

## Sheet Tor.SchDoc
size A3; DrawnBy: Krzysztof Kaczmarczyk
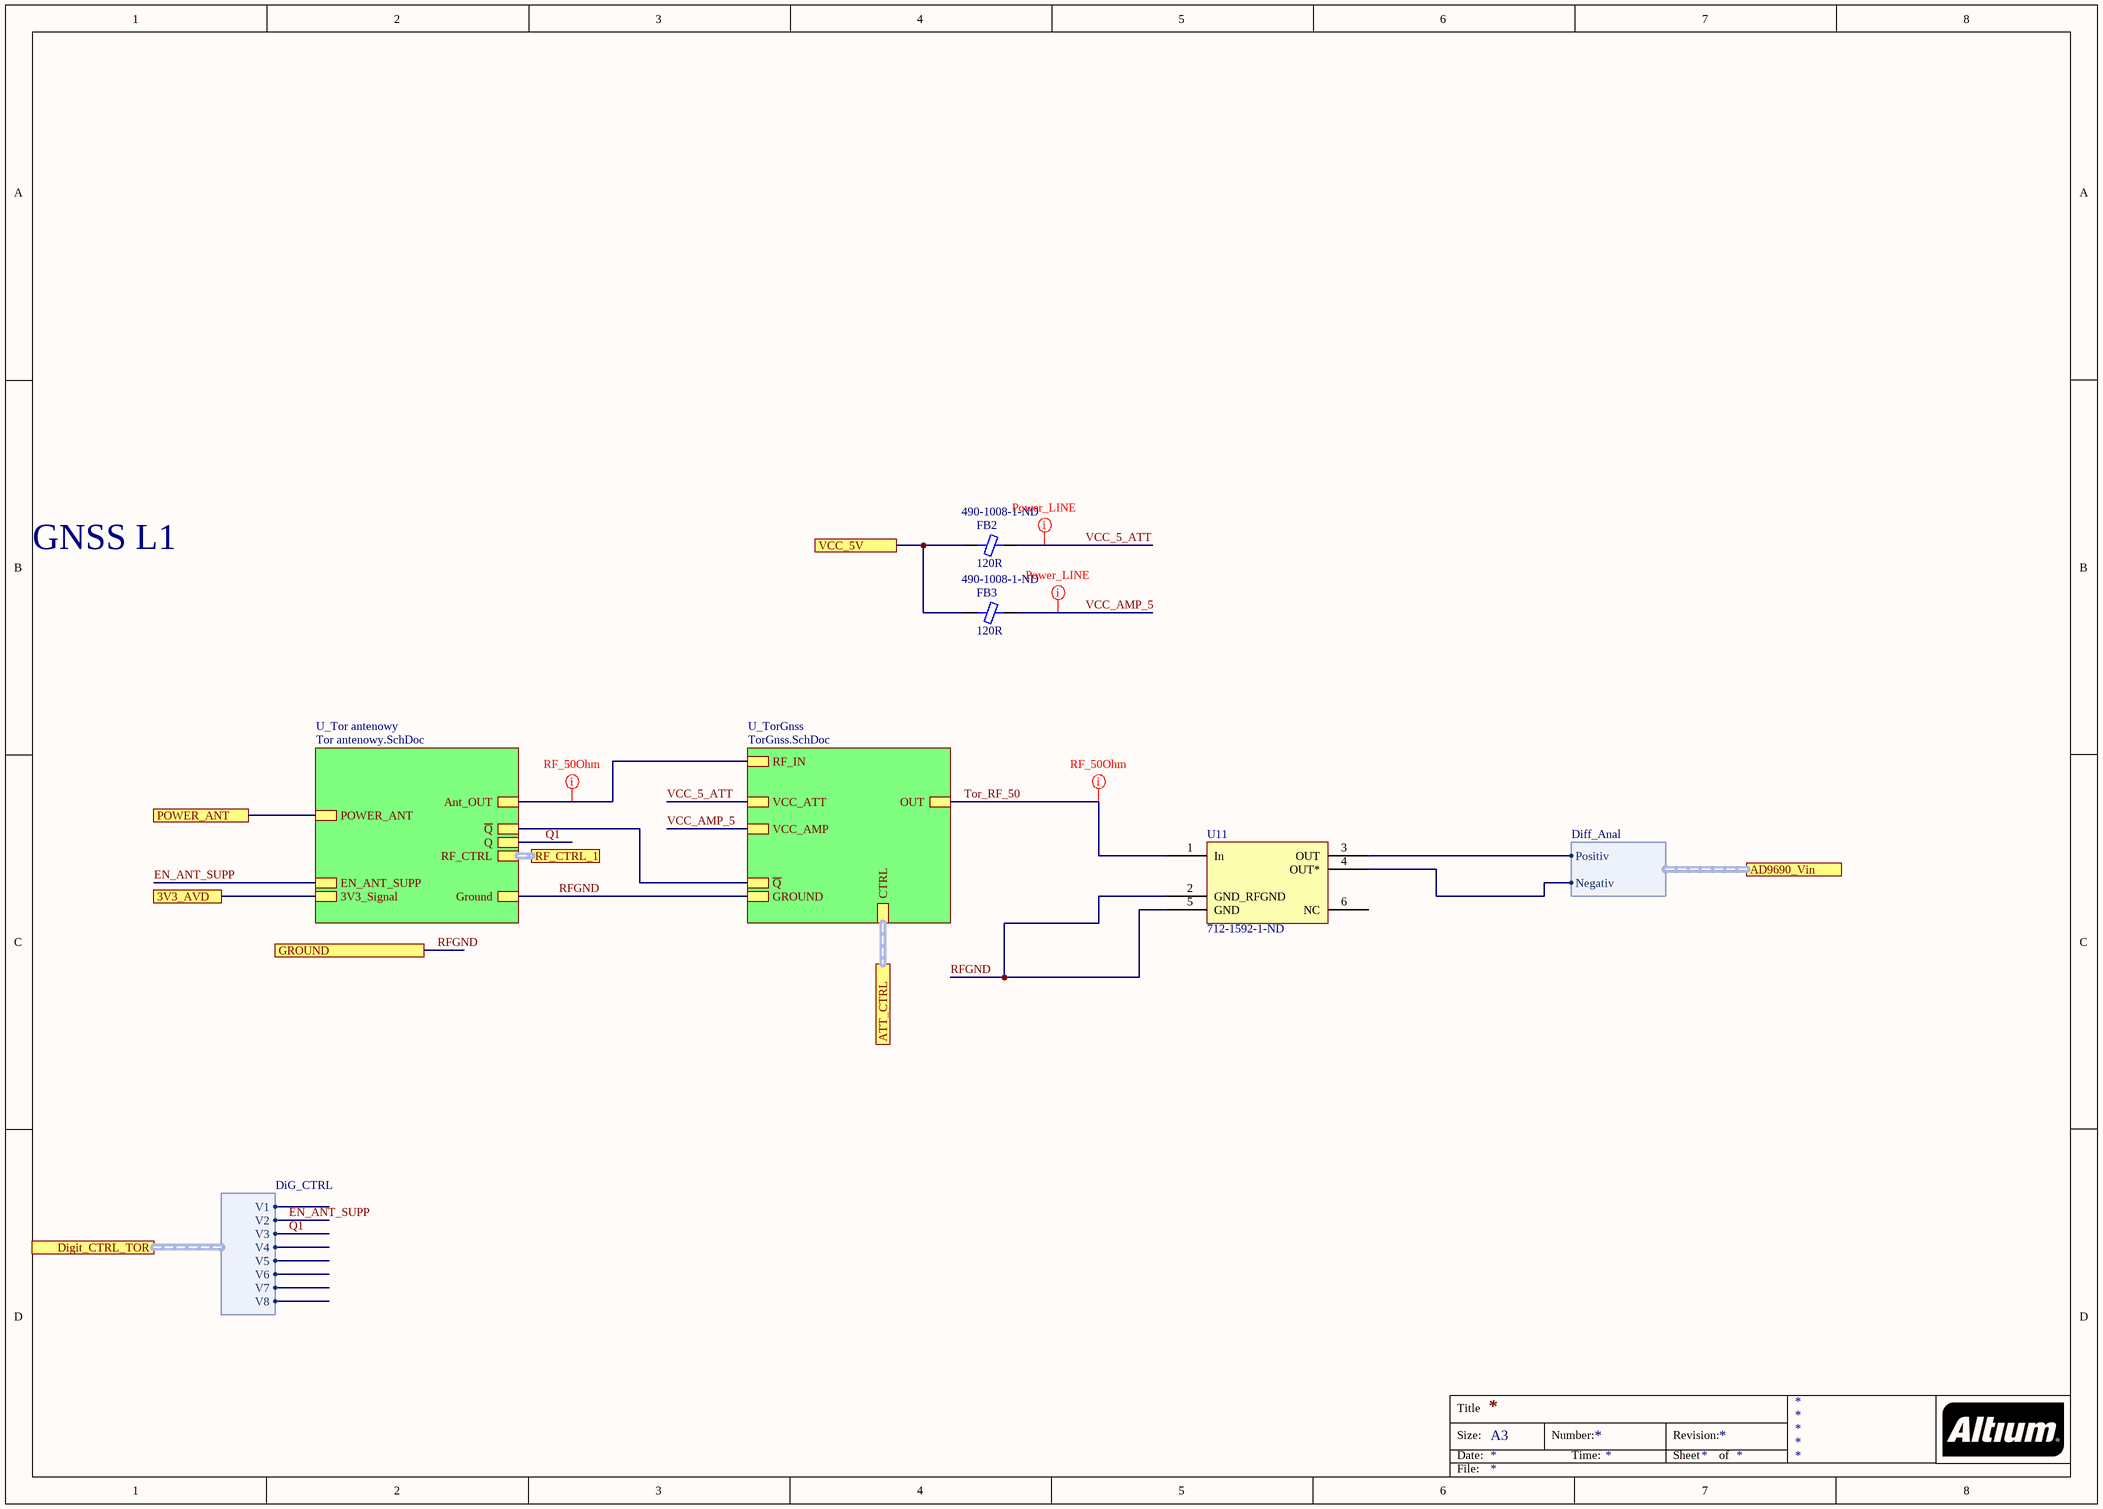
[diagram p3: Tor.SchDoc]

### Parts
FB2  120R  Supplier Part Number 1: 490-1008-1-ND  [FER 0402/1005 KK]
FB3  120R  Supplier Part Number 1: 490-1008-1-ND  [FER 0402/1005 KK]
U11  Supplier Part Number 1: 712-1592-1-ND  [1600BL15B100]  (hidden comment: 1720BL15A0100E)

### Sub-sheets
U_Tor antenowy = Tor antenowy.SchDoc: Ant_OUT, Ground, POWER_ANT, EN_ANT_SUPP, 3V3_Signal, Q, ~{Q}, RF_CTRL (harness RF_CTRL)
U_TorGnss = TorGnss.SchDoc: VCC_ATT, GROUND, VCC_AMP, OUT, RF_IN, CTRL, ~{Q}

### Ports
3V3_AVD, AD9690_Vin (harness Diff_Anal), ATT_CTRL (harness ATT_Controle), Digit_CTRL_TOR (harness DiG_CTRL), GROUND, POWER_ANT, RF_CTRL_1, VCC_5V

### Harnesses
Diff_Anal: Positiv, Negativ
DiG_CTRL: V1, V2, V3, V4, V5, V6, V7, V8

### Nets
RFGND: U11.2(GND_RFGND) U11.5(GND) ; port GROUND, sheet U_TorGnss/GROUND, sheet U_Tor antenowy/Ground
3V3@0A5: port 3V3_AVD, sheet U_Tor antenowy/3V3_Signal
5V: FB2.1 FB3.1 ; port VCC_5V
6V_DCDC: port POWER_ANT, sheet U_Tor antenowy/POWER_ANT
AN_IN_N: U11.4(OUT*) ; port AD9690_Vin.Negativ
AN_IN_P: U11.3(OUT) ; port AD9690_Vin.Positiv
EN_ANT_SUPP: sheet U_Tor antenowy/EN_ANT_SUPP, port Digit_CTRL_TOR.V2
Q1: sheet U_Tor antenowy/Q, port Digit_CTRL_TOR.V3  [project net Q]
~{Q}: sheet U_TorGnss/~{Q}, sheet U_Tor antenowy/~{Q}
Tor_RF_50: U11.1(In) ; sheet U_TorGnss/OUT
VCC_5_ATT: FB2.2 ; sheet U_TorGnss/VCC_ATT
VCC_AMP_5: FB3.2 ; sheet U_TorGnss/VCC_AMP
NetC22_2: sheet U_TorGnss/RF_IN, sheet U_Tor antenowy/Ant_OUT

Not connected (* = marked no-connect by the designer): U11 6(NC)

### Buses and harness runs
harness port ATT_CTRL = sheet U_TorGnss/CTRL
harness port RF_CTRL_1 = sheet U_Tor antenowy/RF_CTRL

### Layout directives
net class Power_LINE: VCC_5_ATT, VCC_AMP_5
net class Single50: NetC22_2, Tor_RF_50

### Notes on the sheet
- GNSS L1
- Title
- Size:
- Date:
- A3
- Number:
- Time:
- Revision:
- Sheet
- of
- File:

### Library data of the parts
FB2 FB3 = Ferrite: Manufacturer 1: Murata; Manufacturer Part Number 1: BLM15BB121SN1D; Material: Ferrite,Steel; Tolerance: 25%; Current Rating: 300mA; DC Resistance (DCR): 550mR; Test Frequency: 100MHz; Shielding: Unshielded; Number of Lines: 1; Supplier 1: Digi-Key; Stock 1: 178432; Pricing 1: 1=0.10000, 10=0.08300, 25=0.07440, 50=0.05440, 100=0.04700, 250=0.03712, 500=0.03136, 1000=0.02640, 5000=0.02351 (USD); RoHS: Yes; Case/Package: 0402; Number of Pins: 2; Case Code (Metric): 1005; Case Code (Imperial): 0402; Core Material: Ferrite; Min Operating Temperature: -55°C; Max Operating Temperature: 125°C; Package Quantity: 1; Packaging: Tape and Reel; Max DC Current: 300mA; Termination: SMD/SMT; Frequency: 100MHz; Composition: Ferrite Bead; Impedance: 120R; Max Current Rating: 300mA; Number of Circuits: 1; Length: 1mm; Height: 0.5mm; Width: 0.5mm; Depth: 0.5mm; Lead Free: Lead Free; REACH SVHC: No SVHC; ComponentLink1URL: https://datasheet.ciiva.com/1466/5145-1466832.pdf?src-supplier=Element14; ComponentLink1Description: https://datasheet.ciiva.com/1466/5145-1466832.pdf?src-supplier=Element14; ComponentLink2URL: https://datasheet.ciiva.com/41449/001172179-da-01-en-drossel-0402-120r-1-0x0-5mm-10000st-41449466.pdf?src-supplier=Conrad; ComponentLink2Description: https://datasheet.ciiva.com/41449/001172179-da-01-en-drossel-0402-120r-1-0x0-5mm-10000st-41449466.pdf?src-supplier=Conrad; ComponentLink3URL: https://datasheet.ciiva.com/1466/5145-1466833.pdf?src-supplier=Element14; ComponentLink3Description: https://datasheet.ciiva.com/1466/5145-1466833.pdf?src-supplier=Element14; ComponentLink4URL: https://datasheet.ciiva.com/3082/l0110s0100blm15b-3082680.pdf?src-supplier=Avnet; ComponentLink4Description: https://datasheet.ciiva.com/3082/l0110s0100blm15b-3082680.pdf?src-supplier=Avnet; ComponentLink5URL: https://datasheet.ciiva.com/16213/l0110s0100blm15b-16213674.pdf?src-supplier=Future+Electronics; ComponentLink5Description: https://datasheet.ciiva.com/16213/l0110s0100blm15b-16213674.pdf?src-supplier=Future+Electronics; ComponentLink6URL: https://datasheet.ciiva.com/1012/l0110s0100blm15b-1012029.pdf?src-supplier=Digi-Key; ComponentLink6Description: https://datasheet.ciiva.com/1012/l0110s0100blm15b-1012029.pdf?src-supplier=Digi-Key; ComponentLink7URL: https://datasheet.ciiva.com/1012/l0110s0100blm15b-1012030.pdf?src-supplier=Digi-Key; ComponentLink7Description: https://datasheet.ciiva.com/1012/l0110s0100blm15b-1012030.pdf?src-supplier=Digi-Key; ComponentLink8URL: https://datasheet.ciiva.com/1012/l0110s0100blm15b-1012031.pdf?src-supplier=Digi-Key; ComponentLink8Description: https://datasheet.ciiva.com/1012/l0110s0100blm15b-1012031.pdf?src-supplier=Digi-Key
U11 = 1720BL15A0100E: BALUN 625MHZ-2.8GHZ 50/100 0805; Manufacturer: Johanson; Supplier 1: Digi-Key; Manufacturer Part Number: 1720BL15A0100E; RoHS: Yes; Stock 1: 10440; Pricing 1: 1=0,64000, 10=0,62500, 25=0,41840, 50=0,37240, 100=0,34110, 250=0,30600, 500=0,29962, 1000=0,21675 (USD); Mount: Surface Mount; Case/Package: 0805; Case Code (Imperial): 0805; Case Code (Metric): 2012; Packaging: Tape and Reel; ComponentLink1URL: http://www.mouser.com/ds/2/611/1720BL15A0100-910138.pdf?src-supplier=Mouser; ComponentLink1Description: http://www.mouser.com/ds/2/611/1720BL15A0100-910138.pdf?src-supplier=Mouser; ComponentLink2URL: https://www.johansontechnology.com/datasheets/baluns/1720BL15A0100.pdf?src-supplier=Digi-Key; ComponentLink2Description: https://www.johansontechnology.com/datasheets/baluns/1720BL15A0100.pdf?src-supplier=Digi-Key; ComponentLink3URL: https://www.johansontechnology.com/datasheets/1720BL15A0100/1720BL15A0100.pdf?src-supplier=Digi-Key; ComponentLink3Description: https://www.johansontechnology.com/datasheets/1720BL15A0100/1720BL15A0100.pdf?src-supplier=Digi-Key